# Altium schematic sheet STM32RF_power_SMPS.SchDoc
size A4; Organization: Arribada Initiative; Address1: https://github.com/arribada; Address2: contact@arribada.org; Address3: arribada.org; Address4: UK - Portsmouth; DocumentNumber: 4; SheetNumber: 4; SheetTotal: 5
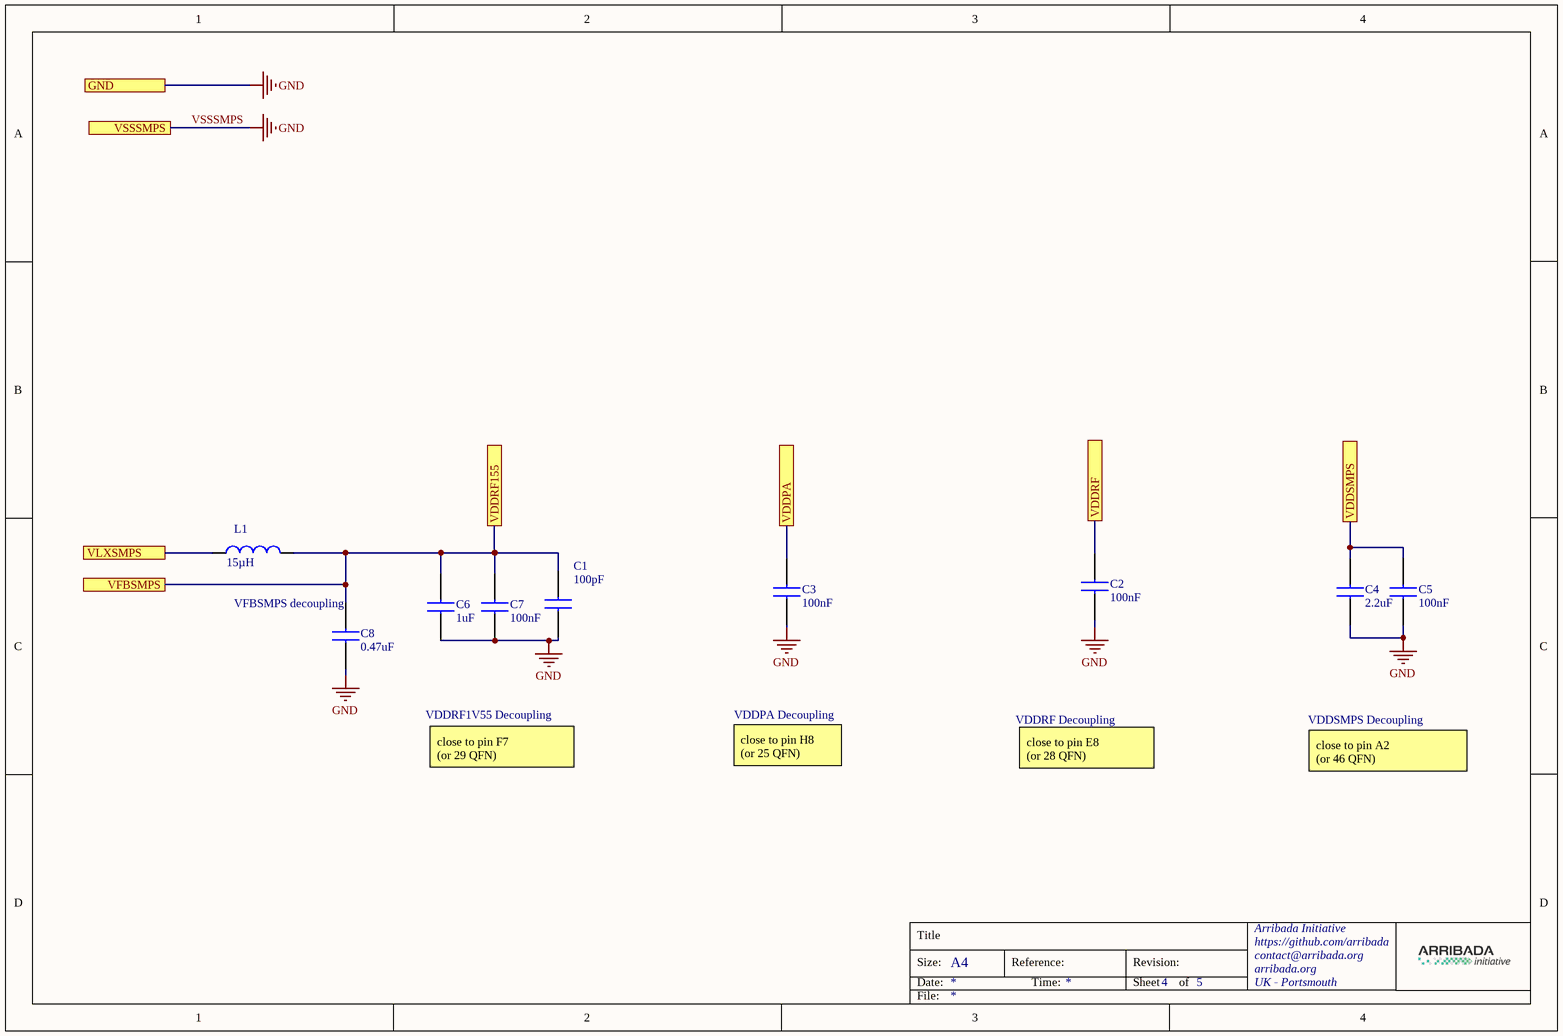
[diagram p0: STM32RF_power_SMPS.SchDoc]

## Parts
C1  100pF  [CAPC0603X33N]
C2  value 100nF  [CAPC0603X33N]  (hidden comment: GRM033R61C104KE14D)
C3  value 100nF  [CAPC0603X33N]  (hidden comment: GRM033R61C104KE14D)
C4  value 2.2uF  [CAPC1005X55N]  (hidden comment: GRM155Z71A225KE44D)
C5  100nF  [CAPC0603X33N]
C6  1uF  [CAPC1005X55N]
C7  100nF  [CAPC0603X33N]
C8  0.47uF  [CAPC1005X55N]
L1  value 15µH  [INDC1608X95N]  (hidden comment: MLZ1608M150WT000)

## Ports
GND (see 2[2B], 3[1A]), VDDPA (see 2[2B], 5[1C]), VDDRF155 (see 2[2B], 5[1C]), VDDRF (see 2[2B]), VDDSMPS (see 2[2B]), VFBSMPS (see 2[2C]), VLXSMPS (see 2[2B]), VSSSMPS (see 2[2C])

## Nets
VSSSMPS: C1.1 C2.2 C3.2 C4.2 C5.1 C6.1 C7.1 C8.2 ; port GND, port VSSSMPS  [also labelled GND]
VDDPA: C3.1 ; port VDDPA
VDDRF: C2.1 ; port VDDRF
VDDRF155: C1.2 C6.2 C7.2 C8.1 L1.2 ; port VDDRF155, port VFBSMPS
VDDSMPS: C4.1 C5.2 ; port VDDSMPS
VLXSMPS: L1.1 ; port VLXSMPS

## Notes on the sheet
- (near C8) VFBSMPS decoupling
- VDDRF1V55 Decoupling
- VDDPA Decoupling
- close to pin F7
  (or 29 QFN)
- close to pin H8
  (or 25 QFN)
- VDDRF Decoupling
- close to pin E8
  (or 28 QFN)
- VDDSMPS Decoupling
- close to pin A2
  (or 46 QFN)
- Title
- Size:
- Date:
- A4
- Reference:
- Time:
- Revision:
- Sheet
- of
- File:

## Library data of the parts
C1 = GRM0335C1E101FA01J: Multilayer Ceramic Capacitors MLCC - SMD/SMT 100 pF 25 VDC 1% 0201 C0G (NP0); Manufacturer 1: Murata; Description 1: Cap Cer 100PF 25V NP0 0201; Voltage Rating: 25V; Height: 0.3mm; Supplier 1: Digi-Key; Supplier Part Number 1: GRM0335C1E101FA01J-ND; Manufacturer Part Number 1: GRM0335C1E101FA01J; RoHS 1: Yes; Category 1: Ceramic Capacitors; Pricing 1: 50000=0,00515 (USD); Mount: Surface Mount; Case/Package: 0201; Case Code (Imperial): 0201; Case Code (Metric): 0603; Min Operating Temperature: -55°C; Max Operating Temperature: 125°C; Packaging: Tape and Reel; Package Quantity: 50000; Capacitance: 100pF; Tolerance: 1%; Voltage Rating (DC): 25V; Dielectric: C0G; Termination: SMD/SMT; Series: GRM; Length: 0.6mm; Width: 0.3mm; RoHS Compliant: Yes; ComponentLink1URL: https://datasheet.ciiva.com/29538/partnumbering-e-01-29538445.pdf?src-supplier=Digi-Key; ComponentLink1Description: https://datasheet.ciiva.com/29538/partnumbering-e-01-29538445.pdf?src-supplier=Digi-Key; Value: 100pF
C2 C3 = GRM033R61C104KE14D: Multilayer Ceramic Capacitors MLCC - SMD/SMT 0201 0.1uF 16volts X5R 10%; Manufacturer_Name: Murata Electronics; Manufacturer 1: Murata; Geometry.Height: 0.33mm; Description 1: 0201 16 V 0.1 uF ±10% Tolerance X5R Dielectric Multilayer Ceramic Chip Capacitor; Voltage Rating (DC): 16V; Mouser Part Number: 81-GRM033R61C104KE4D; Mouser Price/Stock: https://www.mouser.co.uk/ProductDetail/Murata-Electronics/GRM033R61C104KE14D?qs=jHkklCh7amhDvY8zUHp0eA%3D%3D; Manufacturer_Part_Number: GRM033R61C104KE14D; Datasheet Link: http://www.murata.com/~/media/webrenewal/support/library/catalog/products/capacitor/mlcc/c02e.pdf; Supplier 1: Mouser; Supplier Part Number 1: 81-GRM033R61C104KE4D; Manufacturer Part Number 1: GRM033R61C104KE14D; RoHS 1: Yes; Category 1: Ceramic Capacitors; Stock 1: 2429607; Pricing 1: 1=0,1, 10=0,019, 50=0,019, 100=0,011, 1000=0,009, 10000=0,007 (USD); Mount: Surface Mount; Case/Package: 0201; Case Code (Imperial): 0201; Case Code (Metric): 0603; Min Operating Temperature: -55°C; Max Operating Temperature: 85°C; Capacitance: 100nF; Tolerance: 10%; Dielectric: X5R; Series: GRM; Voltage Rating: 16V; Packaging: Tape and Reel; Length: 600um; Width: 300um; Thickness: 300um; RoHS Compliant: Yes; ComponentLink1URL: http://www.farnell.com/datasheets/2735408.pdf?src-supplier=Farnell; ComponentLink1Description: http://www.farnell.com/datasheets/2735408.pdf?src-supplier=Farnell; ComponentLink2URL: https://search.murata.co.jp/Ceramy/image/img/A01X/G101/ENG/GRM033R61C104KE14-01.pdf?src-supplier=Digi-Key; ComponentLink2Description: https://search.murata.co.jp/Ceramy/image/img/A01X/G101/ENG/GRM033R61C104KE14-01.pdf?src-supplier=Digi-Key; ComponentLink3URL: http://www.farnell.com/datasheets/2735408.pdf?src-supplier=Newark; ComponentLink3Description: http://www.farnell.com/datasheets/2735408.pdf?src-supplier=Newark; ComponentLink4URL: http://search.murata.co.jp/Ceramy/image/img/A01X/G101/ENG/GRM033R61C104KE14-01.pdf?src-supplier=Digi-Key; ComponentLink4Description: http://search.murata.co.jp/Ceramy/image/img/A01X/G101/ENG/GRM033R61C104KE14-01.pdf?src-supplier=Digi-Key
C4 = GRM155Z71A225KE44D: Multilayer Ceramic Capacitors MLCC - SMD/SMT 2.2 uF 10 VDC 10% 0402 X7R; Manufacturer 1: Murata; Description 1: Cap Ceramic 2.2uF 10V X7R 10% Pad SMD 0402 125C T/R; Supplier 1: Mouser; Supplier Part Number 1: 81-GRM155Z71A225KE4D; Manufacturer Part Number 1: GRM155Z71A225KE44D; RoHS 1: Yes; Category 1: Ceramic Capacitors; Stock 1: 106743; Pricing 1: 1=0,19, 10=0,077, 50=0,077, 100=0,047, 1000=0,041, 10000=0,035 (USD); Case/Package: 0402; RoHS Compliant: Yes
C5 C7 = GRM033Z71C104KE14D: Multilayer Ceramic Capacitors MLCC - SMD/SMT .1UF     16V   10%        0201; Manufacturer_Name: Murata Electronics; Manufacturer 1: Murata; Geometry.Height: 0.33mm; Description 1: Cap Ceramic 0.1uF 16V X7R 10% Pad SMD 0201 125C T/R; Mouser Part Number: 81-GRM033Z71C104KE4D; Mouser Price/Stock: https://www.mouser.co.uk/ProductDetail/Murata-Electronics/GRM033Z71C104KE14D?qs=lEfY3O89AqkdMqrSfAAk2w%3D%3D; Manufacturer_Part_Number: GRM033Z71C104KE14D; Datasheet Link: http://www.murata.com/~/media/webrenewal/support/library/catalog/products/capacitor/mlcc/c02e.pdf; Supplier 1: Mouser; Supplier Part Number 1: 81-GRM033Z71C104KE4D; Manufacturer Part Number 1: GRM033Z71C104KE14D; RoHS 1: Yes; Category 1: Ceramic Capacitors; Stock 1: 739403; Pricing 1: 1=0,1, 10=0,017, 50=0,017, 100=0,01, 1000=0,008, 10000=0,006 (USD); Case/Package: 0201; RoHS Compliant: Yes
C6 = GRM155Z71A105KE01J: Multilayer Ceramic Capacitors MLCC - SMD/SMT 1.0UF 10V 10% 0402; Manufacturer_Name: Murata Electronics; Manufacturer 1: Murata; Description 1: Multi-Layer Ceramic Capacitor 1uF X7R 10% 0402 Paper T/R; Datasheet Link: http://www.murata.com/~/media/webrenewal/support/library/catalog/products/capacitor/mlcc/c02e.pdf; Height: 0.55mm; Manufacturer_Part_Number: GRM155Z71A105KE01J; Mouser Part Number: 81-GRM155Z71A105KE1J; Mouser Price/Stock: https://www.mouser.co.uk/ProductDetail/Murata-Electronics/GRM155Z71A105KE01J?qs=xZ%2FP%252Ba9zWqaF%2FmyRgV0iOA%3D%3D; Arrow Part Number: GRM155Z71A105KE01J; Arrow Price/Stock: https://www.arrow.com/en/products/grm155z71a105ke01j/murata-manufacturing?region=nac; Supplier 1: Mouser; Supplier Part Number 1: 81-GRM155Z71A105KE1J; Manufacturer Part Number 1: GRM155Z71A105KE01J; RoHS 1: Yes; Category 1: Ceramic Capacitors; Stock 1: 804340; Pricing 1: 1=0,1, 10=0,069, 50=0,069, 100=0,031, 1000=0,018, 10000=0,013 (USD)
C8 = LMK105ABJ474KV8F: Multilayer Ceramic Capacitors MLCC - SMD/SMT  0.47uF 10V X5R 10% SMD 0402 85°C Paper T/R; Manufacturer 1: Taiyo Yuden; Description 1: Capacitor Ceramic 0.47uF 10V X5R 10% SMD 0402 85°C Paper T/R; Value: 470nF; Supplier 1: Mouser; Supplier Part Number 1: 963-LMK105ABJ474KV8F; Manufacturer Part Number 1: LMK105ABJ474KV8F; RoHS 1: Yes; Category 1: Ceramic Capacitors; Stock 1: 26528; Pricing 1: 1=0,1, 10=0,06, 50=0,06, 100=0,028, 1000=0,016, 10000=0,014 (USD)
L1 = MLZ1608M150WT000: Inductor RF Shielded 15µH, ±5%; Manufacturer: TDK; Manufacturer_Part_Number: MLZ2012M150W; Description 1: Inductors For Decoupling Circuits, Multilayer Ferrite; Category 1: Fixed Inductors; Core Material: Ferrite; Tolerance: 20%; Saturation Current: 70mA; DC Resistance (DCR): 1.5R; Inductance: 15uH; Test Frequency: 2MHz; Supplier 1: Mouser; Supplier Part Number 1: 810-MLZ1608M150WT000; Manufacturer 1: TDK; Manufacturer Part Number 1: MLZ1608M150WT000; RoHS 1: Yes; Stock 1: 10538; Pricing 1: 1=0,15, 10=0,103, 50=0,103, 100=0,084, 1000=0,063, 10000=0,051 (USD); Mount: Surface Mount; Case/Package: 0603; Min Operating Temperature: -55°C; Max Operating Temperature: 125°C; Series: MLZ; Shielding: Shielded; RoHS Compliant: Yes